# Altium schematic sheet 串口 PHY.schdoc
size 297 x 209 mm; Symbol: Drawing-Symbol_A4; Company: 嘉立创EDA; Version: V1.0; Page Size: A4; @Project Name: RK3566; @Update Date: 2026-10-06; @Create Date: 2026-05-25; Device: Drawing-Symbol_A4; @Board Name: Board1; @Page Name: P2; @Create Time: 03:23:23; @Page Count: 10; @Page No: 10; @Schematic Name: Schematic1; @Update Time: 03:23:23; @Assembly Variant: Basic; Border: 1; Title Block Position: 3; Size: A4; Width: 1170; Height: 825; Region Start: 1; X Region Count: 6; Y Region Count: 4; Blade Width: 10; SheetNumber: 8; SheetTotal: 11
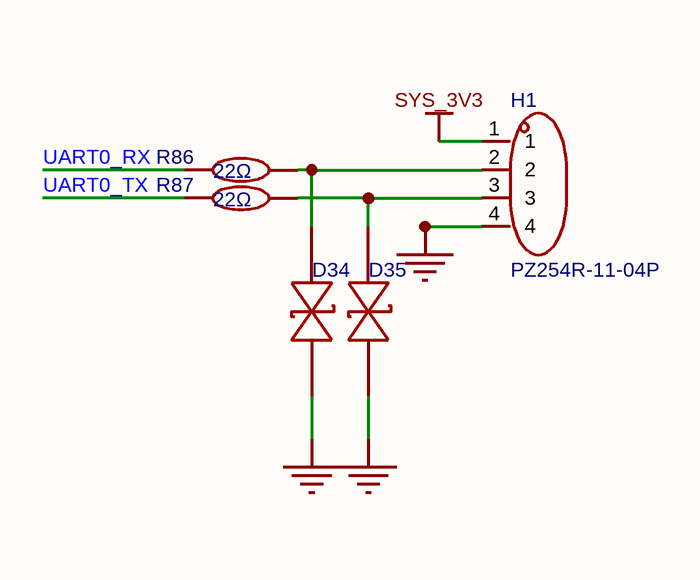
[diagram p0: 串口 PHY.schdoc]

## Parts
D34  BDFN1C051R  [DFN0603-D_L0.6-W0.3-P0.34-BI]  (value not drawn)
D35  BDFN1C051R  [DFN0603-D_L0.6-W0.3-P0.34-BI]  (value not drawn)
H1  PZ254R-11-04P  [HDR-TH_4P-P2.54-H-M-W10.4]
R86  22Ω  [R0402]
R87  22Ω  [R0402]

## Nets
GND: D34.1 D35.1 H1.4
SYS_3V3: H1.1
UART0_RX: R86.1
UART0_TX: R87.1
NetD34_2: D34.2 H1.2 R86.2
NetD35_2: D35.2 H1.3 R87.2

## Notes on the sheet
- 创建日期
- 2026-10-06
- 原理图
- 板子
- Schematic1
- Board1
- 更新日期
- 图页
- P2
- 绘制
- 审阅
- RK3566
- 版本
- V1.0
- 尺寸
- A4
- 页    10    共    10
- 嘉立创EDA

## Library data of the parts
D34 D35 = BDFN1C051R: 极性:双向;反向截止电压(Vrwm):5V;钳位电压:13V;峰值脉冲电流(Ipp):4A@8/20us;击穿电压(VBR):5.5V;; Manufacturer: BORN(伯恩半导体); 3D Model: 295ccb0e91f84fca9fcc42e8f031306b聨0819f05c4eef4c71ace90d822a990e87; 3D Model Transform: 24.0157,12.2047,0,0,0,0,0,0,0; Polarity: 双向; Reverse Stand-Off Voltage (Vrwm): 5V; Clamping Voltage: 13V; Voltage - Breakdown: 5.5V; Reverse Leakage Current (Ir): 100nA; Number of Channels: 单路; level of protection: IEC 61000-4-4；IEC 61000-4-5；IEC 61000-4-2; Type: ESD; Junction Capacitance: 0.2pF; AddInBom: yes; ModelName: DFN0603-D_L0.6-W0.3--H0.3-P0.34-BI; Symbol: BDFN1C051R; Device: BDFN1C051R; LCSC Part Name: 双向ESD 5V截止 峰值脉冲电流：4A@8/20us; Supplier Part: C152032; Manufacturer Part: BDFN1C051R; Supplier Footprint: DFN0603-D; JLCPCB Part Class: Extended Part; Datasheet: https://item.szlcsc.com/datasheet/BDFN1C051R/163372.html; Supplier: LCSC; Peak Pulse Current (Ipp): 4A@8/20us; ConvertToPcb: yes; FootprintName: DFN0603-D_L0.6-W0.3-P0.34-BI
H1 = PZ254R-11-04P: 插针结构:1x4P;间距:2.54mm;行距:-;圆针/方针:方针;安装方式:弯插;排数:单排;总PIN位数:4P;额定电流:3A;额定电压:250V;配合针长度:6mm;塑高:2.5mm;端接针长度:-;触头材质:黄铜;触头镀层:-;工作温度:-40℃~+105℃;颜色:黑色;; Manufacturer: XFCN(兴飞); AddInBom: yes; ModelId: d6c429cf28314298a2074cefd68172f0聨0819f05c4eef4c71ace90d822a990e87; ModelName: HDR-TH_4P-P2.54-M-WI-1X4P; ModelTransform: 399.999,417.322,0,180,0,0,0,-196.85,-118.11; Pin Structure: 1x4P; Pitch: 2.54mm; Circluar Pins/Square Pins: 方针; Current Rating: 3A; Voltage Rating (Max): 250V; Symbol: PZ254R-11-04P; Device: PZ254R-11-04P; LCSC Part Name: 1x4P 间距:2.54mm 方针 弯插; SupplierPart: C492412; ManufacturerPart: PZ254R-11-04P; Supplier Footprint: 弯插,P=2.54mm; JLCPCB Part Class: Extended Part; Datasheet: https://item.szlcsc.com/datasheet/PZ254R-11-04P/502968.html; Supplier: LCSC; ConvertToPcb: yes; FootprintName: HDR-TH_4P-P2.54-H-M-W10.4; Row Spacing: -; Mounting Type: 弯插; Number of Rows: 单排; Number of Pins: 4P; Length of Mating Pin: 6mm; Insulation Height: 2.5mm; Length of End Connection Pin: -; Contact Material: 黄铜; Contact Plating: -; Operating Temperature: -40℃~+105℃; Color: 黑色
R86 R87 = 0402WGF220JTCE: 电阻类型:厚膜电阻;阻值:22Ω;精度:±1%;功率:62.5mW;最大工作电压:50V;温度系数:±100ppm/℃;; Manufacturer: UNI-ROYAL(厚声); AddInBom: yes; ModelId: 98c88bc2b9094f218f3a3e30a7012738聨0819f05c4eef4c71ace90d822a990e87; ModelName: R0402_L1.0-W0.5-H0.4; ModelTransform: 39.37,19.685,0,0,0,0,0,0,0; Tolerance: ±1%; Power(Watts): 62.5mW; Overload Voltage (Max): 50V; Symbol: 0402WGF220JTCE; Device: 0402WGF220JTCE; LCSC Part Name: 22Ω ±1% 62.5mW 厚膜电阻; SupplierPart: C25092; ManufacturerPart: 0402WGF220JTCE; Supplier Footprint: 0402; JLCPCB Part Class: Basic Part; Datasheet: https://atta.szlcsc.com/upload/public/pdf/source/20200306/C422600_1E6D84923E4A46A82E41ADD87F860B5C.pdf; Supplier: LCSC; ConvertToPcb: yes; FootprintName: R0402; Type: 厚膜电阻; Value: 22Ω; Temperature Coefficient: ±100ppm/℃; Operating Temperature Range: -55℃~+155℃